# Altium project Zasilacz.PrjPcb
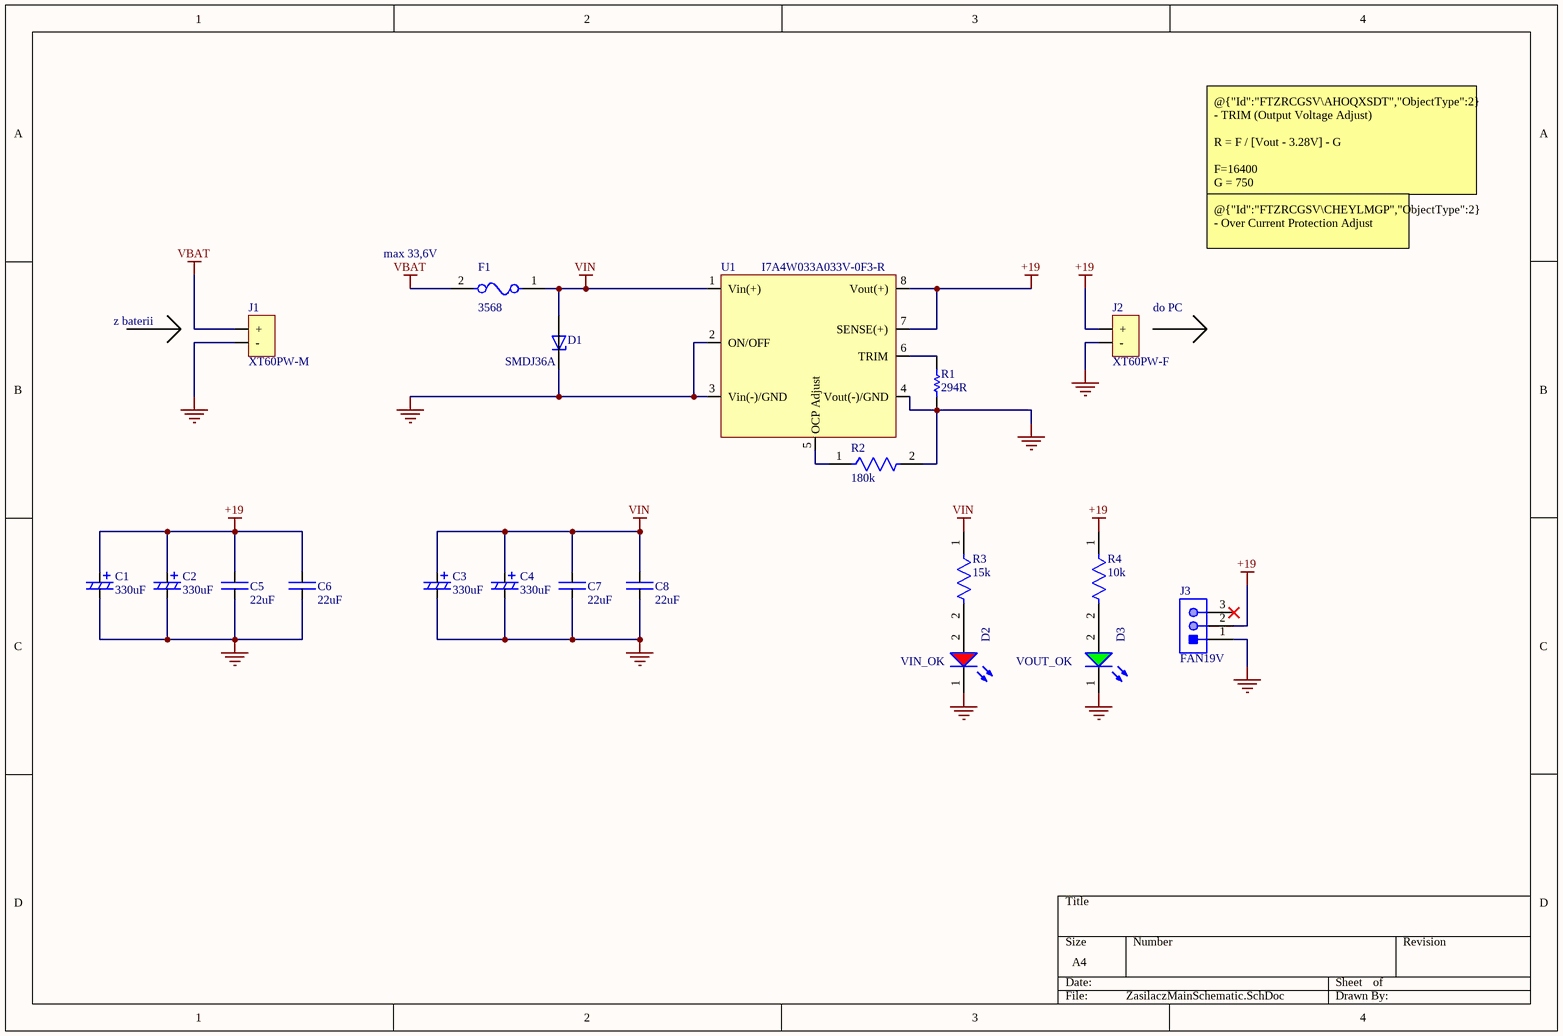
[diagram p0: ZasilaczMainSchematic.SchDoc]
1 sheet, 20 parts. Net scope: global (net labels, ports and power ports of the same name join across sheets).
Board file: ZasilaczPCB.PcbDoc

## Sheet ZasilaczMainSchematic.SchDoc
size A4; SheetNumber: 1; SheetTotal: 1

### Parts
C1  330uF  [RAHT1331M1UGL5005E]
C2  330uF  [RAHT1331M1UGL5005E]
C3  330uF  [RAHT1331M1UGL5005E]
C4  330uF  [RAHT1331M1UGL5005E]
C5  22uF  [CAPC6050X550N]
C6  22uF  [CAPC6050X550N]
C7  22uF  [CAPC6050X550N]
C8  22uF  [CAPC6050X550N]
D1  SMDJ36A  [DIOM6859X262N]
D2  VIN_OK  [WL-SMCW_0805_150080xx75000]
D3  VOUT_OK  [WL-SMCW_0805_150080xx75000]
F1  3568  [FP-3568-MFG]
J1  XT60PW-M  [AMASS_XT60PW-M]
J2  XT60PW-F  [AMASS_XT60PW-F]
J3  FAN19V  [MOLX-22-23-2031_V]
R1  294R  [RESC2013X60X35LL10T20]
R2  180k  [FP-CRGP0805-IPC_C]
R3  15k  [FP-CRCW0805-e3-IPC_C]
R4  10k  [FP-CRCW0805-e3-IPC_A]
U1  I7A4W033A033V-0F3-R  [CONV_I7A4W033A033V-0F3-R]

### Nets
+19: C1.1 C2.1 C5.2 C6.2 J2.1(+) J3.2 R4.1 U1.7(SENSE(+)) U1.8(Vout(+))
GND: C1.2 C2.2 C3.2 C4.2 C5.1 C6.1 C7.1 C8.1 D1.C D2.1(K) D3.1(K) J1.2(-) J2.2(-) J3.1 R1.1 R2.2 U1.2(ON/OFF) U1.3(Vin(-)/GND) U1.4(Vout(-)/GND)
VBAT: F1.2 J1.1(+)
VIN: C3.1 C4.1 C7.2 C8.2 D1.A F1.1 R3.1 U1.1(Vin(+))
NetD2_2: D2.2(A) R3.2
NetD3_2: D3.2(A) R4.2
NetR1_2: R1.2 U1.6(TRIM)
NetR2_1: R2.1 U1.5(OCP_Adjust)

Not connected (* = marked no-connect by the designer): J3 3*

### Notes on the sheet
- @{"Id":"FTZRCGSV\AHOQXSDT","ObjectType":2} - TRIM (Output Voltage Adjust)
  R = F / [Vout - 3.28V] - G
  F=16400
  G = 750
  Vout = 19V
- @{"Id":"FTZRCGSV\CHEYLMGP","ObjectType":2} - Over Current Protection Adjust
  From Chart: R2 = 180k -> ~20A
- (near F1) max 33,6V
- (near J2) do PC
- z baterii

### Library data of the parts
C1-C4 = RAHT1331M1UGL5005E: Aluminum Organic Polymer Capacitors 50V 330uF 105C ESR=2mOhms AECQ 12.5x12.5mm
C5-C8 = CAP: CKG57NX7S1H226M500JH / Specialty Ceramic Capacitors CKG 2220 50V 22uF X7S 20% T: 5mm
D1 = SMDJ36A: 3000W, 42.1V, 5%, Unidirectional, TVS; MF: Taiwan Semiconductor; Package: SMC-2 Taiwan Semiconductor; Check_prices: https://www.snapeda.com/parts/SMDJ36A/Taiwan+Semiconductor/view-part/?ref=eda; Price: None; Purchase-URL: https://pricing.snapeda.com/search/part/SMDJ36A/?ref=eda; Value: *; MP: SMDJ36A; SnapEDA_Link: https://www.snapeda.com/parts/SMDJ36A/Taiwan+Semiconductor/view-part/?ref=snap; Availability: In Stock
D2 = CMP-1426-00011-5: 150080RS75000 / LED Uni-Color Red 630nm 2-Pin Chip 0805(2012Metric) T/R; Manufacturer Lifecycle Status: ACTIVE; Test Current: 20mA; Forward Voltage: 2V; YEOL: 1 = Estimated lifetime > 10 years; Lens Style: Clear, Rectangular; Max Junction Temperature (Tj): 95°C; Dominant Wavelength: 625nm; Max Reverse Voltage (DC): 5V; Power Dissipation: 72mW; Viewing Angle: 140°; Luminous Intensity: 150mcd; Forward Current: 100mA; Case/Package: 0805; Case Code (Imperial): 0805; RoHS: Compliant; Min Operating Temperature: -40°C; Packaging: Tape and Reel; Peak Wavelength: 630nm; REACH SVHC: Unknown; Max Operating Temperature: 85°C; Lifecycle Status: Production; Length: 2mm; Wavelength: 625nm; Mount: Surface Mount; Manufacturer Package Identifier: 0805 (2012 metric); Case Code (Metric): 2012; Width: 1.25mm; Color: Red; Height: 700µm
D3 = CMP-1426-00007-5: 150080GS75000 / WURTH ELEKTRONIK - 150080GS75000 - LED, Green, SMD, 0805, 30 mA, 3.2 V, 520 nm; Manufacturer Lifecycle Status: ACTIVE; Manufacturer Package Identifier: 0805 (2012 metric); Wavelength: 525nm; Test Current: 20mA; Luminous Intensity: 450mcd; Max Reverse Voltage (DC): 5V; YEOL: 1 = Estimated lifetime > 10 years; Power Dissipation: 105mW; Viewing Angle: 140°; Peak Wavelength: 515nm; Forward Voltage: 3.2V; Forward Current: 100mA; Lens Style: Clear, Rectangular; Max Junction Temperature (Tj): 95°C; Case/Package: 0805; Height: 700µm; Packaging: Tape and Reel; Max Operating Temperature: 85°C; Lifecycle Status: Production; REACH SVHC: Unknown; Length: 2mm; Width: 1.25mm; Mount: Surface Mount; Reverse Voltage: 5V; Dominant Wavelength: 525nm; Case Code (Metric): 2012; RoHS: Compliant; Case Code (Imperial): 0805; Color: Green; Min Operating Temperature: -40°C
F1 = CMP-2000-05464-2: NexarPartId: 8116161; Approvals: UL; Body Material: Nylon; Illumination Type: Illuminated; Voltage Rating (AC): 500V; Current Rating: 20A; Number of Poles: 1; Color: Black; Material: Brass, Nylon, Tin; Depth: 6.73mm; Max Operating Temperature: 145°C; Length: 16mm; Mount: PCB, Vertical; REACH SVHC: No SVHC; Lead Free: Lead Free; Min Operating Temperature: -50°C; Flammability Rating: UL94 V-0; RoHS: Compliant; Orientation: Vertical; Fuse Current: 20A; Termination: PC Pin; Number of Circuits: 1; Contact Plating: Tin; Voltage: 500V; Contact Material: Brass
J3 = CMP-2000-05242-1: 22-23-2031 / Male Header, Pitch 2.54 mm, 1 x 3 Position, Height 8.18 mm, Tail Length 3.56 mm, RoHS, Bulk; Current Rating: 4A; Brand: Molex; Pitch: 2.54mm; Voltage Rating: 250V; Mounting Angle: Vertical; Type: Locking; Factory Pack Quantity: 16000; Tradename: KK; Housing Material: Nylon; Contact Material: Brass; Manufacturer URL: http://www.molex.com/; Termination Style: ThroughHole; Mounting Style: ThroughHole; Number of Positions: 3Position; Contact Gender: Pin(Male); Packaging: Bulk; Series: 6373; Datasheet Version: Sep-01; Contact Plating: Tin; Product: Headers; Datasheet URL: https://datasheet.ciiva.com/19472/232274-19472863.pdf; RoHS: Details; Product Category: Headers&WireHousings; Manufacturer: Molex; Number of Rows: 1Row
R1 = CMP-1013-00448-2: RC0805FR-07294RL / Thick Film Resistors - SMD General Purpose Chip Resistor 0805, 294Ohms, 1%, 1/8W; Manufacturer: Yageo; Part Number: RC0805FR-07294RL
R2 = CMP-03211-011052-1: CRGP0805F180K 180KΩ 0.33W ±100ppm/°C 1% 150V; Manufacturer: TE; Tolerance: 0.01; Temperature: -55°C to +155°C; Temperature Coefficient: ±100ppm/°C; Temperature Range Low: -55°C; Package: CRGP0805; Voltage Rating: 150V; RoHS: TRUE; Value: 180KΩ; Height: 0.65mm; Lead Free: Yes; Device Class L3: Chip SMD Resistors; Automotive: No; ComponentLink2Description: Datasheet; Series: CRGP; Temperature Range High: +155°C; Resistance: 180KΩ; Octopart: https://octopart.com/crgp0805f180k-te+connectivity-91018792; Device Class L2: Resistors; Ipc Land Pattern Name: RESC200125X55; Composition: Thick Film; Ambient Temperature Range High: +70°C; Manufacturer Part Number: CRGP0805F180K; Category: Res; Power Rating: 0.33W; Device Class L1: Passive Components; ComponentLink2URL: https://www.mouser.com/datasheet/2/418/NG_DS_9-1773463-9_A-1358566.pdf
R3 = CMP-2001-04967-2: CRCW080515K0FKEA / RES Thick Film, 15kΩ, 1%, 0.125W, 100ppm/°C, 0805; Power Rating: 125mW; Voltage Rating: 150V; Resistance: 15kR; Height: 0.45mm; Number of Terminations: 2; Composition: Thick Film; Length: 2mm; Case/Package: 0805; Depth: 1.25mm; Min Operating Temperature: -55°C; Lead Free: Lead Free; Mount: Surface Mount; Package Quantity: 10; Termination: SMD/SMT; Packaging: Tape and Reel; Case Code (Metric): 2012; Features: Automotive AEC-Q200; Military Standard: Not; Width: 0.049inch; Temperature Coefficient: 100ppm/°C; Max Power Dissipation: 125mW; Weight: 0.000194oz; Tolerance: 1%; Voltage Rating (DC): 150V; Max Operating Temperature: 155°C; Radiation Hardening: No; Contact Plating: Tin; Case Code (Imperial): 0805
R4 = CMP-2001-04908-2: CRCW080510K0FKEA / RES Thick Film, 10kΩ, 1%, 0.125W, 100ppm/°C, 0805; Resistance: 10kR; Voltage Rating (DC): 150V; Power Rating: 125mW; Weight: 0.000194oz; Package Quantity: 5000; Military Standard: Not; Max Operating Temperature: 155°C; Temperature Coefficient: 100ppm/°C; Contact Plating: Tin; Width: 1.25mm; Height: 0.45mm; Radiation Hardening: No; Tolerance: 1%; Min Operating Temperature: -55°C; Voltage Rating: 150V; Length: 2mm; Depth: 1.25mm; Termination: SMD/SMT; Packaging: Tape and Reel; Case/Package: 0805; Case Code (Metric): 2012; Lead Free: Lead Free; Case Code (Imperial): 0805; Composition: Thick Film
U1 = I7A4W033A033V-0F3-R: 400W-1000W, 9-18V, 18-32V, 18-50V or 28-60V Input Non-Isolated Step Down DC-DC Converter